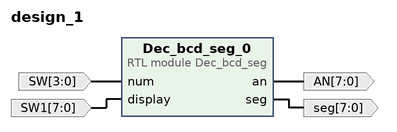
[diagram p0: block diagram of the top level]
# Vivado block design design_1, xc7a100tcsg324-1, Vivado 2017.4.1
create_bd_design design_1

create_bd_port -dir I -from 3 -to 0 SW
create_bd_port -dir I -from 7 -to 0 SW1
create_bd_port -dir O -from 7 -to 0 AN
create_bd_port -dir O -from 7 -to 0 seg

create_bd_cell -type module -reference Dec_bcd_seg Dec_bcd_seg_0

# ---- connections ----

connect_bd_net -net num_0_1 [get_bd_ports SW] [get_bd_pins Dec_bcd_seg_0/num]
connect_bd_net -net display_0_1 [get_bd_ports SW1] [get_bd_pins Dec_bcd_seg_0/display]
connect_bd_net [get_bd_pins Dec_bcd_seg_0/an] [get_bd_ports AN]
connect_bd_net [get_bd_pins Dec_bcd_seg_0/seg] [get_bd_ports seg]

validate_bd_design
save_bd_design
